# Altium schematic sheet Force_Sensors.SchDoc
size A4; SheetNumber: 4; SheetTotal: 5
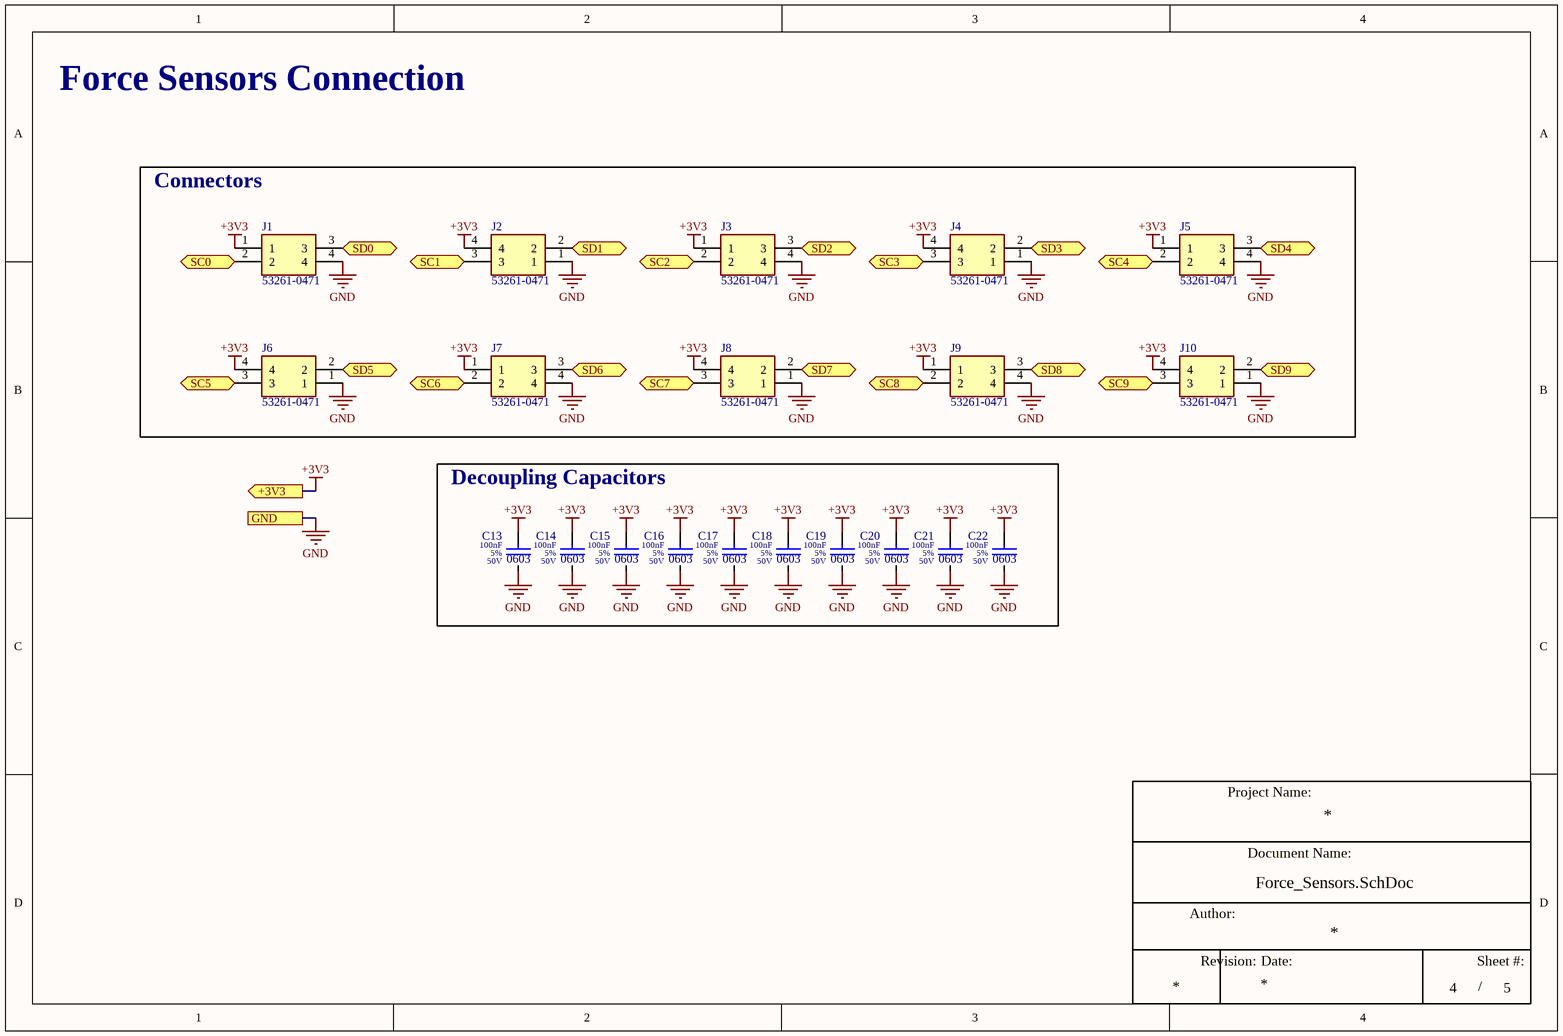
[diagram p0: Force_Sensors.SchDoc]

## Parts
C13  value 100nF  Tolerance: 5%  Voltage Rating: 50V  Case/Package: 0603  [0603_Capacitor]  (hidden comment: C_100n_50V_0603_5)
C14  value 100nF  Tolerance: 5%  Voltage Rating: 50V  Case/Package: 0603  [0603_Capacitor]  (hidden comment: C_100n_50V_0603_5)
C15  value 100nF  Tolerance: 5%  Voltage Rating: 50V  Case/Package: 0603  [0603_Capacitor]  (hidden comment: C_100n_50V_0603_5)
C16  value 100nF  Tolerance: 5%  Voltage Rating: 50V  Case/Package: 0603  [0603_Capacitor]  (hidden comment: C_100n_50V_0603_5)
C17  value 100nF  Tolerance: 5%  Voltage Rating: 50V  Case/Package: 0603  [0603_Capacitor]  (hidden comment: C_100n_50V_0603_5)
C18  value 100nF  Tolerance: 5%  Voltage Rating: 50V  Case/Package: 0603  [0603_Capacitor]  (hidden comment: C_100n_50V_0603_5)
C19  value 100nF  Tolerance: 5%  Voltage Rating: 50V  Case/Package: 0603  [0603_Capacitor]  (hidden comment: C_100n_50V_0603_5)
C20  value 100nF  Tolerance: 5%  Voltage Rating: 50V  Case/Package: 0603  [0603_Capacitor]  (hidden comment: C_100n_50V_0603_5)
C21  value 100nF  Tolerance: 5%  Voltage Rating: 50V  Case/Package: 0603  [0603_Capacitor]  (hidden comment: C_100n_50V_0603_5)
C22  value 100nF  Tolerance: 5%  Voltage Rating: 50V  Case/Package: 0603  [0603_Capacitor]  (hidden comment: C_100n_50V_0603_5)
J1  53261-0471  [53261-0471]
J2  53261-0471  [53261-0471]
J3  53261-0471  [53261-0471]
J4  53261-0471  [53261-0471]
J5  53261-0471  [53261-0471]
J6  53261-0471  [53261-0471]
J7  53261-0471  [53261-0471]
J8  53261-0471  [53261-0471]
J9  53261-0471  [53261-0471]
J10  53261-0471  [53261-0471]

## Blocks framed on the sheet
Connectors: J1-J10
Decoupling Capacitors: C13-C22

## Ports
+3V3 (out), GND, SC0 (bidir), SC1 (bidir), SC2 (bidir), SC3 (bidir), SC4 (bidir), SC5 (bidir), SC6 (bidir), SC7 (bidir), SC8 (bidir), SC9 (bidir), SD0 (bidir), SD1 (bidir), SD2 (bidir), SD3 (bidir), SD4 (bidir), SD5 (bidir), SD6 (bidir), SD7 (bidir), SD8 (bidir), SD9 (bidir)

## Nets
+3V3: C13.1 C14.1 C15.1 C16.1 C17.1 C18.1 C19.1 C20.1 C21.1 C22.1 J1.1 J2.4 J3.1 J4.4 J5.1 J6.4 J7.1 J8.4 J9.1 J10.4 ; port +3V3
GND: C13.2 C14.2 C15.2 C16.2 C17.2 C18.2 C19.2 C20.2 C21.2 C22.2 J1.4 J2.1 J3.4 J4.1 J5.4 J6.1 J7.4 J8.1 J9.4 J10.1 ; port GND
SC0: J1.2 ; port SC0
SC1: J2.3 ; port SC1
SC2: J3.2 ; port SC2
SC3: J4.3 ; port SC3
SC4: J5.2 ; port SC4
SC5: J6.3 ; port SC5
SC6: J7.2 ; port SC6
SC7: J8.3 ; port SC7
SC8: J9.2 ; port SC8
SC9: J10.3 ; port SC9
SD0: J1.3 ; port SD0
SD1: J2.2 ; port SD1
SD2: J3.3 ; port SD2
SD3: J4.2 ; port SD3
SD4: J5.3 ; port SD4
SD5: J6.2 ; port SD5
SD6: J7.3 ; port SD6
SD7: J8.2 ; port SD7
SD8: J9.3 ; port SD8
SD9: J10.2 ; port SD9

## Notes on the sheet
- Force Sensors Connection
- Project Name:
- Author:
- Document Name:
- Revision:
- Date:
- Sheet #:
- /

## Library data of the parts
C13-C22 = CMP-001-00008-27: Capacitor Type: Ceramic; Revision Num.: 1; HelpURL: https://www.tme.eu/Document/78f46414e6dac38b7cca12338ea208b0/X7RDielectric.pdf; Mounting Technology: SMT
J1-J10 = 53261-0471: Connector; Manufacturer_Name: Molex; Datasheet Link: http://www.molex.com/webdocs/datasheets/pdf/en-us//0532610471_PCB_HEADERS.pdf; Manufacturer_Part_Number: 53261-0471; Mouser Part Number: 538-53261-0471; Mouser Price/Stock: https://www.mouser.co.uk/ProductDetail/Molex/53261-0471?qs=%252B72YyncTwW9e3et3PwnEMw%3D%3D; Arrow Part Number: 53261-0471; Arrow Price/Stock: null?region=nac